# Altium schematic sheet HMI Part.SchDoc
size A4; SheetNumber: 6; SheetTotal: 6
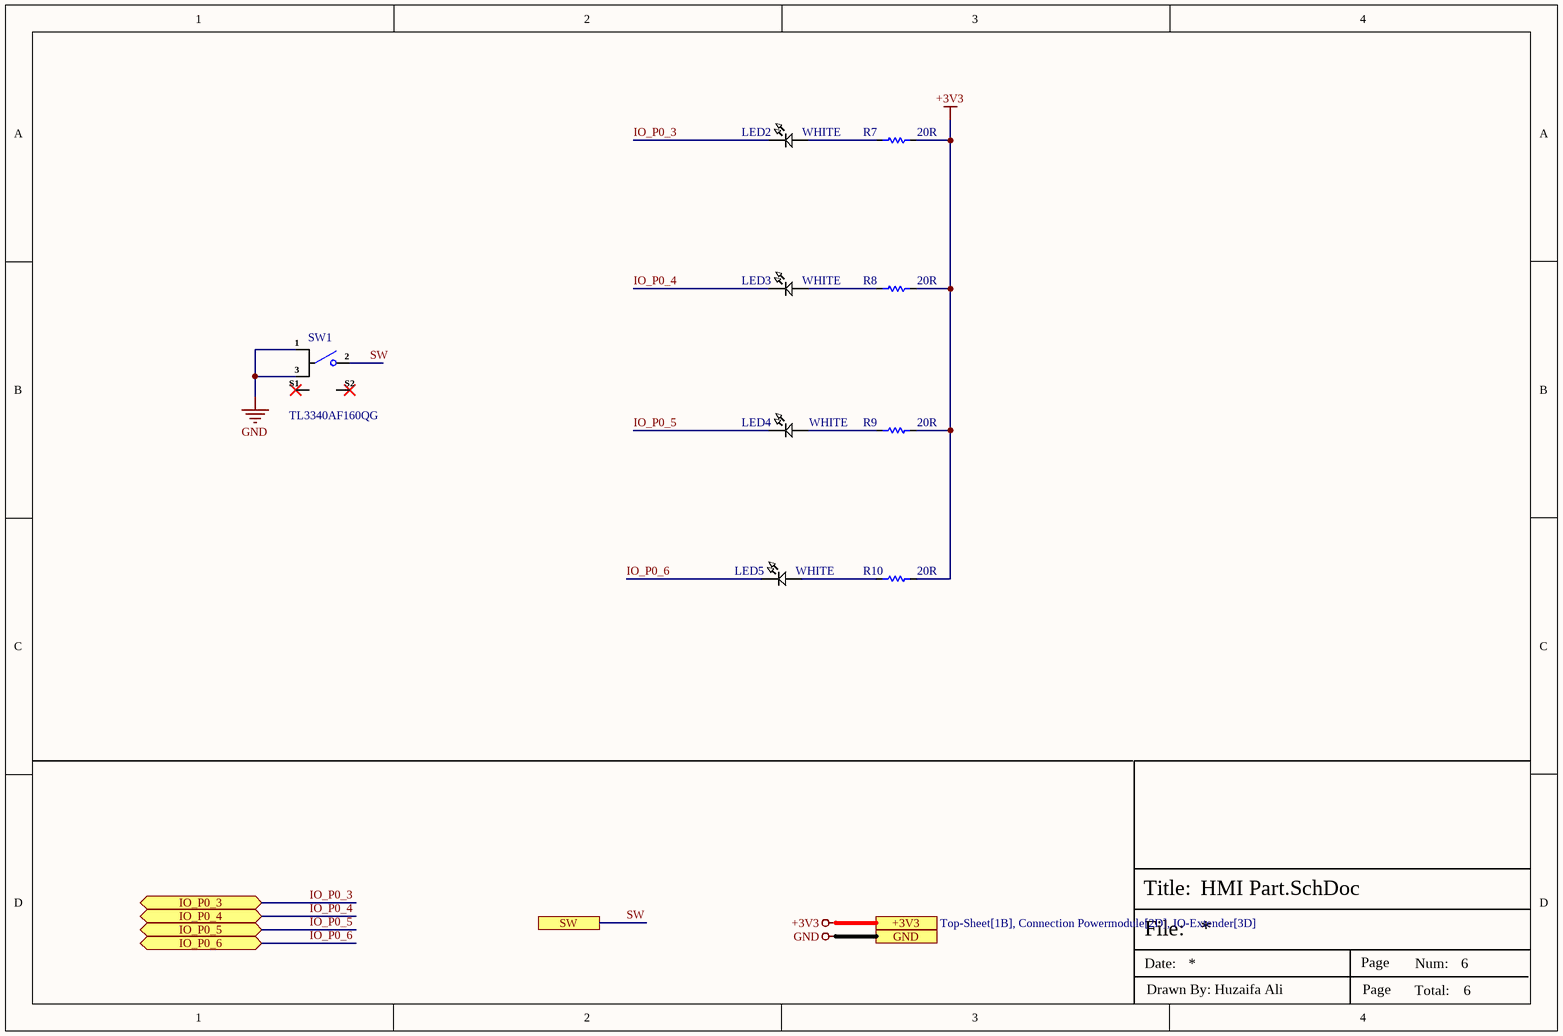
[diagram p0: HMI Part.SchDoc]

## Parts
LED2  WHITE  [LED-0603]
LED3  WHITE  [LED-0603]
LED4  WHITE  [LED-0603]
LED5  WHITE  [LED-0603]
R7  20R  [Res-0603]
R8  20R  [Res-0603]
R9  20R  [Res-0603]
R10  20R  [Res-0603]
SW1  TL3340AF160QG  [TL3340AF160QG]

## Ports
+3V3 (see Top-Sheet[1B], Connection Powermodule[2D], IO-Extender[3D]), GND (see Top-Sheet[1B], Connection Powermodule[2D], IO-Extender[3D], MOSFET Driving[2D], Pad Connections[3D]), IO_P0_3 (bidir, see Top-Sheet[2B], IO-Extender[2D]), IO_P0_4 (bidir, see Top-Sheet[2B], IO-Extender[2D]), IO_P0_5 (bidir, see Top-Sheet[2B], IO-Extender[2D]), IO_P0_6 (bidir, see Top-Sheet[2B], IO-Extender[2D]), SW (see Top-Sheet[1B], Connection Powermodule[1D])

## Nets
+3V3: R7.2 R8.2 R9.2 R10.2 ; port +3V3
GND: SW1.1(COM_1) SW1.3(COM_2) ; port GND
IO_P0_3: LED2.2 ; port IO_P0_3
IO_P0_4: LED3.2 ; port IO_P0_4
IO_P0_5: LED4.2 ; port IO_P0_5
IO_P0_6: LED5.2 ; port IO_P0_6
SW: SW1.2(NO) ; port SW
NetLED2_1: LED2.1 R7.1
NetLED3_1: LED3.1 R8.1
NetLED4_1: LED4.1 R9.1
NetLED5_1: LED5.1 R10.1

Not connected (* = marked no-connect by the designer): SW1 S1(GND)* S2(GND)*

## Notes on the sheet
- File:
- Title:
- Date:
- Page
- Num:
- Total:
- Drawn By: Huzaifa Ali

## Library data of the parts
LED2-LED5 = NCD0603W1: 5mA 200mcd~300mcd 雾状黄透镜 -30℃~+85℃ White 130° 72mW 2.6V~3.6V 0603 Light Emitting Diodes (LED) ROHS; Manufacturer: Foshan NationStar Optoelectronics; Manufacturer Part Number: NCD0603W1; Package: 0603; LCSC Part Number: C84265; Item Type: LED; ComponentLink1Description: LCSC; ComponentLink1URL: https://www.lcsc.com/product-detail/Light-Emitting-Diodes-LED_Foshan-NationStar-Optoelectronics-NCD0603W1_C84265.html
R7-R10 = 0603WAF200JT5E: 100mW Thick Film Resistors ±100ppm/℃ ±1% 20Ω 0603 Chip Resistor - Surface Mount ROHS; Manufacturer: UNI-ROYAL(Uniroyal Elec); Manufacturer Part Number: 0603WAF200JT5E; LCSC Part Number: C22950; Package: 0603; Item Type: Resistor; ComponentLink1Description: LCSC; ComponentLink1URL: https://www.lcsc.com/product-detail/Chip-Resistor-Surface-Mount_UNI-ROYAL-Uniroyal-Elec-0603WAF200JT5E_C22950.html
SW1 = TL3340AF160QG: Switch Tactile N.O. SPST Round Button Gull Wing 0.05A 12VDC 100000Cycles 1.57N SMD; Manufacturer: E-Switch; Actuator Material: Polyphthalamide; Number of Positions: 2NUMBER; Contact Current Rating: 50mA; Operating Force: 160gf; Voltage Rating (DC): 12V; Contact Resistance: 500mR; Illumination Type: Non-Illuminated,Illuminated; Switch Travel: 0.2mm; Switch Function: Off-Mom; Actuator Type: Standard; Actuator Length: 0.85mm; Supplier: Future Electronics; Supplier Part Number: 9232661; Manufacturer Part Number: TL3340AF160QG; RoHS: Yes; Category: Tactile Switches; Stock: 16000; Pricing: 2000=0.27 (USD); Mounting Technology: Surface Mount; Case/Package: SMD/SMT; Contact Material: Stainless Steel,Silver; Contact Plating: Stainless Steel,Silver; Color: White; Mechanical Life: 100000Cycles; Housing Material: Polyphthalamide; Min Operating Temperature: -35°C; Max Operating Temperature: 85°C; Throw Configuration: SPST; Package Quantity: 1; Packaging: Tape and Reel; Current Rating: 50mA; Max Voltage Rating (DC): 12V; Termination: Gull Wing; Electrical Life: 100000Cycles; Orientation: Right Angle; Series: TL3340; Height: 3.55mm; Size: 3.3mm; Reach SVHC Compliant: No; Lead Free: 5697LeadFree; RoHS Compliant: Yes; ComponentLink1URL: https://datasheet.ciiva.com/7637/tl3340-7637667.pdf?src-supplier=Element14; ComponentLink1Description: https://datasheet.ciiva.com/7637/tl3340-7637667.pdf?src-supplier=Element14; ComponentLink2URL: https://datasheet.ciiva.com/5284/tl3340-28153-5284108.pdf?src-supplier=Mouser; ComponentLink2Description: https://datasheet.ciiva.com/5284/tl3340-28153-5284108.pdf?src-supplier=Mouser; ComponentLink3URL: https://datasheet.ciiva.com/2900/p021301b-2900825.pdf?src-supplier=Digikey; ComponentLink3Description: https://datasheet.ciiva.com/2900/p021301b-2900825.pdf?src-supplier=Digikey; ComponentLink4URL: https://datasheet.ciiva.com/2900/p021301b-2900826.pdf?src-supplier=Digikey; ComponentLink4Description: https://datasheet.ciiva.com/2900/p021301b-2900826.pdf?src-supplier=Digikey; ComponentLink5URL: https://datasheet.ciiva.com/2900/p021301b-2900827.pdf?src-supplier=Digikey; ComponentLink5Description: https://datasheet.ciiva.com/2900/p021301b-2900827.pdf?src-supplier=Digikey